# Altium schematic sheet ADC-AUX_SHEET.SchDoc
size A; SheetNumber: 5; SheetTotal: 9
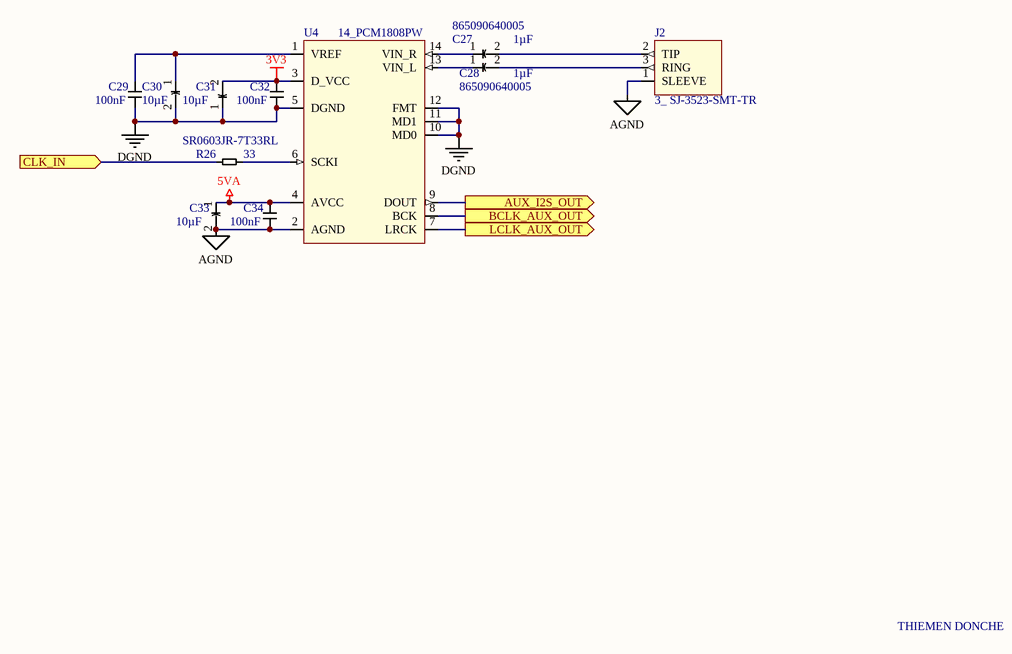
[diagram p0: ADC-AUX_SHEET.SchDoc]

## Parts
C27  1µF  Supplier Part Number 1: 865090640005  [4.0-5.5_ELCO-CAP]
C28  1µF  Supplier Part Number 1: 865090640005  [4.0-5.5_ELCO-CAP]
C29  100nF  [0603_SMD_CAP]
C30  10µF  [4.0-5.5_ELCO-CAP]
C31  10µF  [4.0-5.5_ELCO-CAP]
C32  100nF  [0603_SMD_CAP]
C33  10µF  [4.0-5.5_ELCO-CAP]
C34  100nF  [0603_SMD_CAP]
J2  3_ SJ-3523-SMT-TR  [SMD-3_SJ-3523-SMT-TR]
R26  33  type: SR0603JR-7T33RL  [0603_SMD_PACKAGE]
U4  14_PCM1808PW  [TSSOP-14_PCM1808PW]

## Ports
AUX_I2S_OUT (out, see TOP_SHEET[2A]), BCLK_AUX_OUT (out, see TOP_SHEET[2A]), CLK_IN (in, see TOP_SHEET[1A], DAC_SHEET[1B]), LCLK_AUX_OUT (out, see TOP_SHEET[2A])

## Nets
3V3: C31.2 C32.2 U4.3(D_VCC)
5VA: C33.1 C34.2 U4.4(AVCC)
AGND: C33.2 C34.1 J2.1(SLEEVE) U4.2(AGND)
DGND: C29.1 C30.2 C31.1 C32.1 U4.5(DGND) U4.10(MD0) U4.11(MD1) U4.12(FMT)
AUX_I2S_OUT: U4.9(DOUT) ; port AUX_I2S_OUT
BCLK_AUX_OUT: U4.8(BCK) ; port BCLK_AUX_OUT
CLK_IN: R26.1 ; port CLK_IN
LCLK_AUX_OUT: U4.7(LRCK) ; port LCLK_AUX_OUT
NetC27_1: C27.1 U4.14(VIN_R)
NetC27_2: C27.2 J2.2(TIP)
NetC28_1: C28.1 U4.13(VIN_L)
NetC28_2: C28.2 J2.3(RING)
NetC29_2: C29.2 C30.1 U4.1(VREF)
NetR26_2: R26.2 U4.6(SCKI)

## Notes on the sheet
- THIEMEN DONCHE

## Library data of the parts
C27 C28 C30 C31 C33 = electrolitische condensator: type: *; Supplier 1: Farnell
  C30 C31 C33: Supplier Part Number 1: 865090640005
C29 C32 C34 = ceramic capacator: type: *
J2 = 3_ SJ-3523-SMT-TR: audiojack, 3pos, 3.5mm; Supplier 1: Future Electronics; Supplier Part Number 1: SJ-3523-SMT-TR
R26 = resistor
U4 = 14_PCM1808PW: ADC, 2 converters, sampling rate = 96kHz, I2S out, Vb = 4.5V-5.5V; Supplier 1: Arrow Electronics; Supplier Part Number 1: PCM1808PW